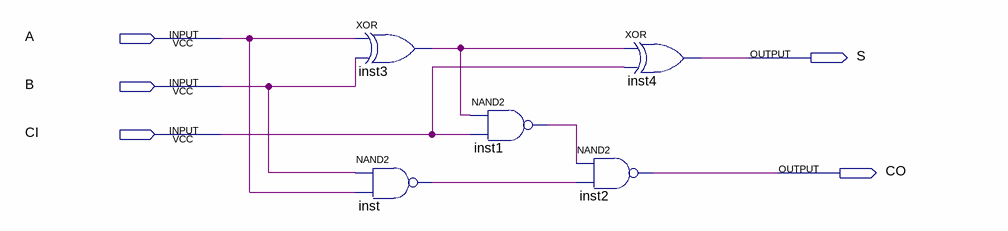
[diagram p0: schematic sheet]
// Quartus schematic F_ADDER.bdf as structural Verilog: 5 symbols, 5 pins
module F_ADDER (
  input  A,
  input  B,
  input  CI,
  output S,
  output CO
);

  wire inst1_out, inst3_out, inst_out;

  xor inst3 (inst3_out, A, B);
  nand inst (inst_out, B, A);
  nand inst1 (inst1_out, inst3_out, CI);
  xor inst4 (S, inst3_out, CI);
  nand inst2 (CO, inst1_out, inst_out);
endmodule
